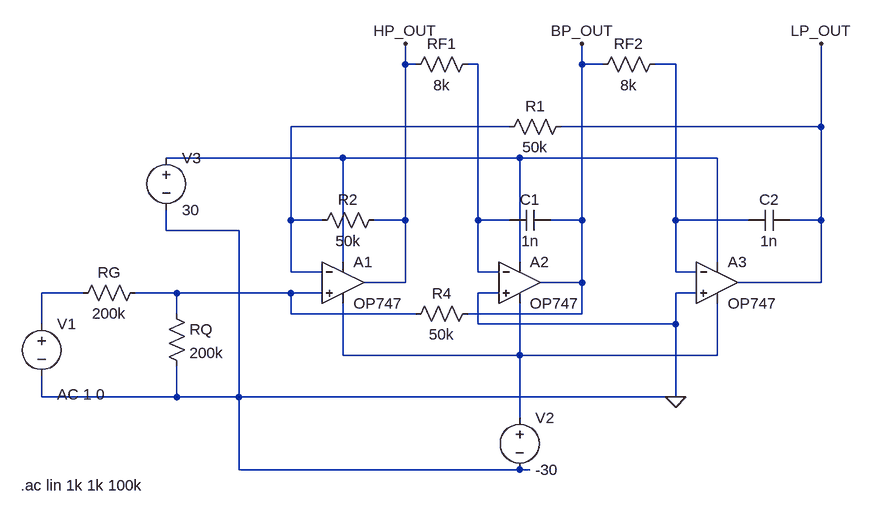
[diagram p0: schematic state_variable_filter.asc]
state_variable_filter.asc, the LTspice schematic file:
Version 4.1
SHEET 1 928 680
WIRE 224 -96 224 -128
WIRE 240 -96 224 -96
WIRE 336 -96 320 -96
WIRE 496 -96 496 -128
WIRE 528 -96 496 -96
WIRE 640 -96 608 -96
WIRE 384 0 48 0
WIRE 864 0 864 -128
WIRE 864 0 464 0
WIRE 128 48 -144 48
WIRE 400 48 128 48
WIRE 704 48 400 48
WIRE 48 144 48 0
WIRE 96 144 48 144
WIRE 224 144 224 -96
WIRE 224 144 176 144
WIRE 336 144 336 -96
WIRE 384 144 336 144
WIRE 496 144 496 -96
WIRE 496 144 448 144
WIRE 640 144 640 -96
WIRE 752 144 640 144
WIRE 864 144 864 0
WIRE 864 144 816 144
WIRE -144 160 -144 128
WIRE -32 160 -144 160
WIRE 128 208 128 48
WIRE 400 208 400 48
WIRE 704 208 704 48
WIRE 48 224 48 144
WIRE 96 224 48 224
WIRE 336 224 336 144
WIRE 368 224 336 224
WIRE 640 224 640 144
WIRE 672 224 640 224
WIRE 224 240 224 144
WIRE 224 240 160 240
WIRE 496 240 496 144
WIRE 496 240 432 240
WIRE 864 240 864 144
WIRE 864 240 736 240
WIRE -272 256 -336 256
WIRE -128 256 -192 256
WIRE 48 256 -128 256
WIRE 96 256 48 256
WIRE 368 256 336 256
WIRE 672 256 640 256
WIRE -128 288 -128 256
WIRE 48 288 48 256
WIRE 240 288 48 288
WIRE 496 288 496 240
WIRE 496 288 320 288
WIRE -336 304 -336 256
WIRE 336 304 336 256
WIRE 640 304 640 256
WIRE 640 304 336 304
WIRE 128 352 128 272
WIRE 400 352 400 272
WIRE 400 352 128 352
WIRE 704 352 704 272
WIRE 704 352 400 352
WIRE -336 416 -336 384
WIRE -128 416 -128 368
WIRE -128 416 -336 416
WIRE -32 416 -32 160
WIRE -32 416 -128 416
WIRE 640 416 640 304
WIRE 640 416 -32 416
WIRE 400 448 400 352
WIRE -32 528 -32 416
WIRE 400 528 -32 528
WIRE 416 528 400 528
FLAG 640 416 0
FLAG 864 -128 LP_OUT
FLAG 496 -128 BP_OUT
FLAG 224 -128 HP_OUT
SYMBOL OpAmps\\OP747 128 176 R0
SYMATTR InstName A1
SYMBOL OpAmps\\OP747 400 176 R0
SYMATTR InstName A2
SYMBOL OpAmps\\OP747 704 176 R0
SYMATTR InstName A3
SYMBOL cap 816 128 R90
WINDOW 0 0 32 VBottom 2
WINDOW 3 32 32 VTop 2
SYMATTR InstName C2
SYMATTR Value 1n
SYMBOL cap 448 128 R90
WINDOW 0 0 32 VBottom 2
WINDOW 3 32 32 VTop 2
SYMATTR InstName C1
SYMATTR Value 1n
SYMBOL res 336 272 R90
WINDOW 0 0 56 VBottom 2
WINDOW 3 32 56 VTop 2
SYMATTR InstName R4
SYMATTR Value 50k
SYMBOL res 336 -112 R90
WINDOW 0 0 56 VBottom 2
WINDOW 3 32 56 VTop 2
SYMATTR InstName RF1
SYMATTR Value 8k
SYMBOL res 624 -112 R90
WINDOW 0 0 56 VBottom 2
WINDOW 3 32 56 VTop 2
SYMATTR InstName RF2
SYMATTR Value 8k
SYMBOL res 192 128 R90
WINDOW 0 0 56 VBottom 2
WINDOW 3 32 56 VTop 2
SYMATTR InstName R2
SYMATTR Value 50k
SYMBOL res 480 -16 R90
WINDOW 0 0 56 VBottom 2
WINDOW 3 32 56 VTop 2
SYMATTR InstName R1
SYMATTR Value 50k
SYMBOL res -144 272 R0
SYMATTR InstName RQ
SYMATTR Value 200k
SYMBOL res -176 240 R90
WINDOW 0 0 56 VBottom 2
WINDOW 3 32 56 VTop 2
SYMATTR InstName RG
SYMATTR Value 200k
SYMBOL voltage -336 288 R0
WINDOW 123 24 124 Left 2
WINDOW 39 0 0 Left 0
SYMATTR Value2 AC 1 0
SYMATTR InstName V1
SYMATTR Value ""
SYMBOL voltage 400 432 R0
WINDOW 123 0 0 Left 0
WINDOW 39 0 0 Left 0
SYMATTR InstName V2
SYMATTR Value -30
SYMBOL voltage -144 32 R0
WINDOW 123 0 0 Left 0
WINDOW 39 0 0 Left 0
SYMATTR InstName V3
SYMATTR Value 30
TEXT -368 552 Left 2 !.ac lin 1k 1k 100k

The netlist it stands for:
* state_variable_filter.asc
X§A1 N006 N003 N004 N007 HP_OUT OP747  ; pins In+ In- V+ V- OUT
X§A2 0 N001 N004 N007 BP_OUT OP747  ; pins In+ In- V+ V- OUT
X§A3 0 N002 N004 N007 LP_OUT OP747  ; pins In+ In- V+ V- OUT
C2 LP_OUT N002 1n
C1 BP_OUT N001 1n
R4 BP_OUT N006 50k
RF1 N001 HP_OUT 8k
RF2 N002 BP_OUT 8k
R2 HP_OUT N003 50k
R1 LP_OUT N003 50k
RQ N006 0 200k
RG N006 N005 200k
V1 N005 0 AC 1 0
V2 N007 0 -30
V3 N004 0 30
.ac lin 1k 1k 100k
.backanno
.end